# Altium schematic sheet 10_POWER_INPUT.SchDoc
size 594 x 420 mm
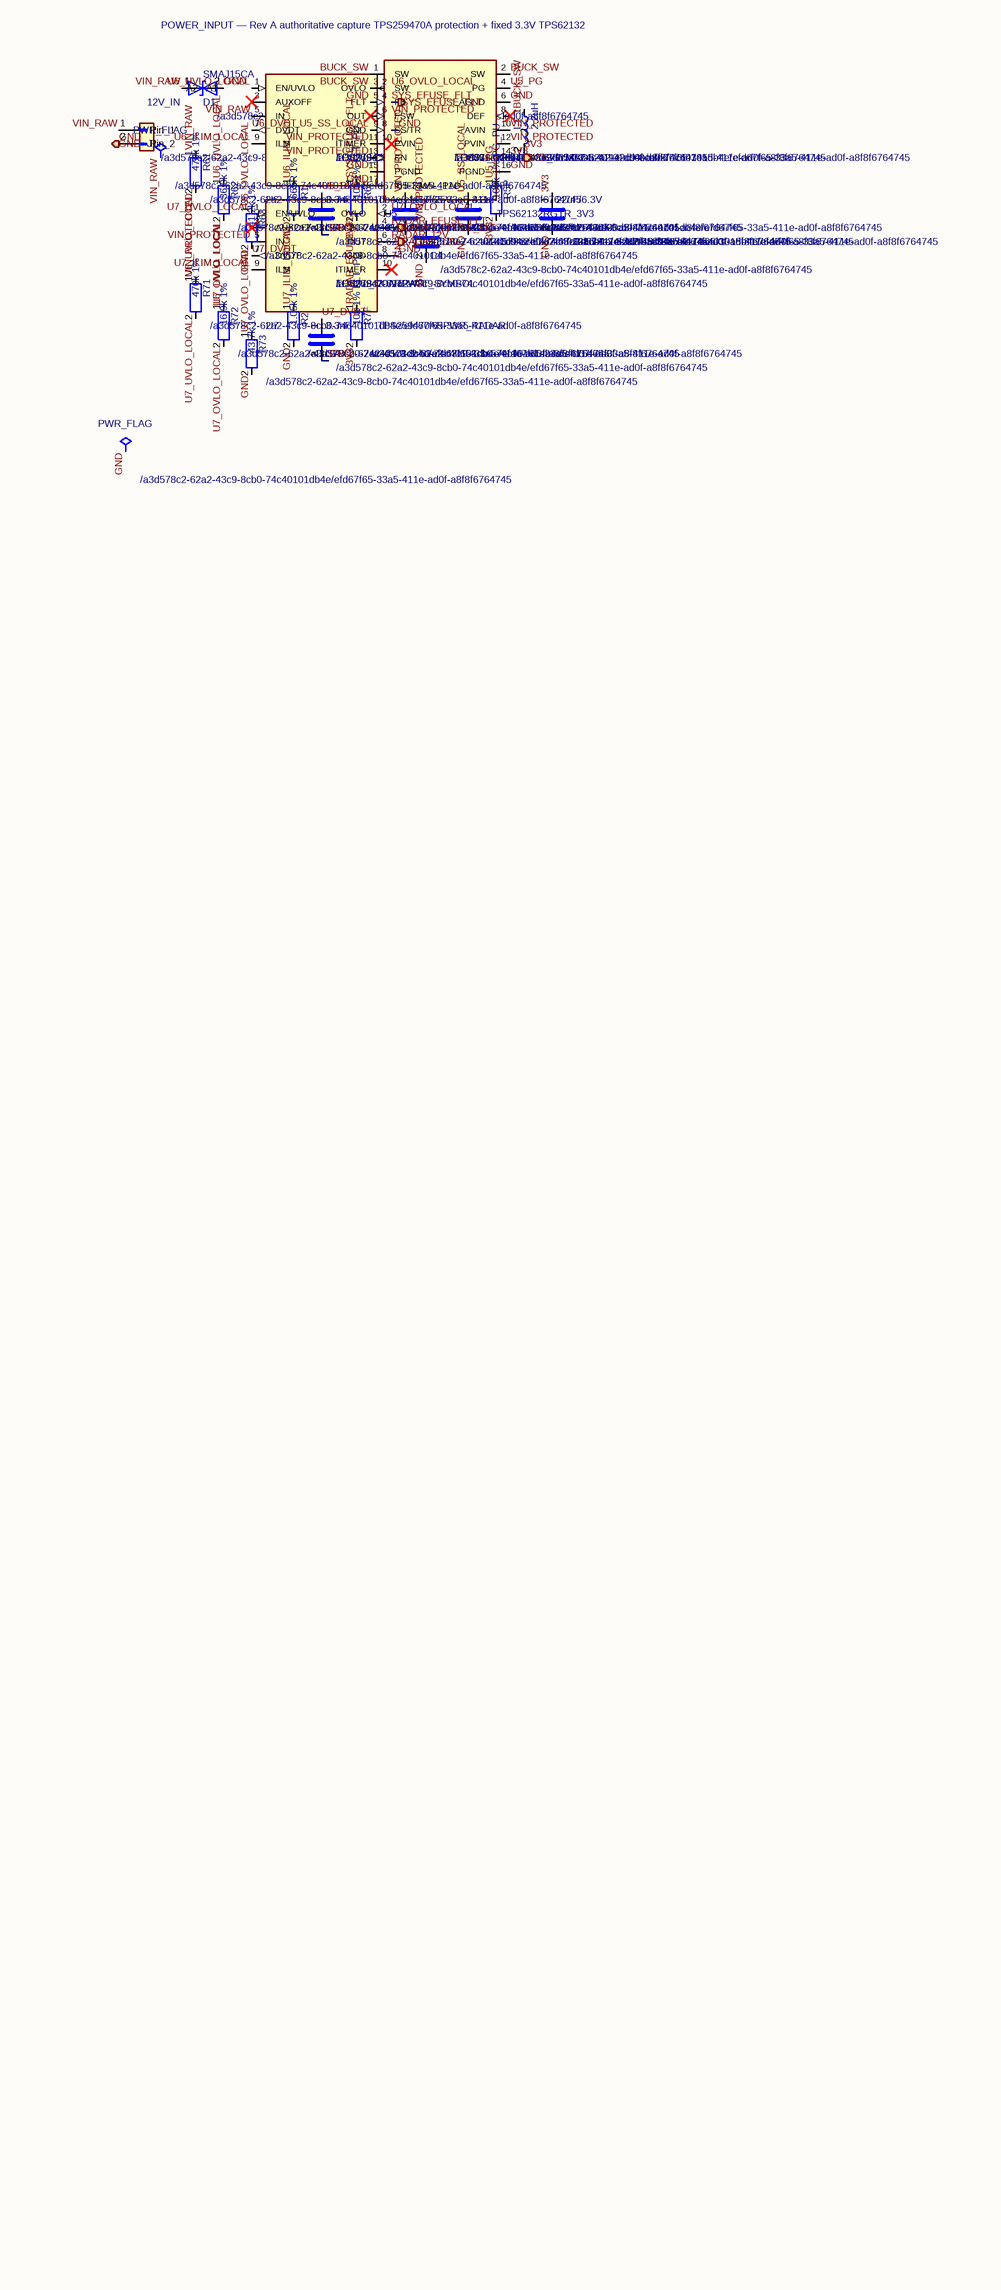
[diagram p0: 10_POWER_INPUT.SchDoc]

## Parts
#FLG0201  hierarchy_path: /a3d578c2-62a2-43c9-8cb0-74c40101db4e/efd67f65-33a5-411e-ad0f-a8f8f6764745  (hidden comment: PWR_FLAG)  (graphical)
#FLG0202  hierarchy_path: /a3d578c2-62a2-43c9-8cb0-74c40101db4e/efd67f65-33a5-411e-ad0f-a8f8f6764745  (hidden comment: PWR_FLAG)  (graphical)
C1  hierarchy_path: /a3d578c2-62a2-43c9-8cb0-74c40101db4e/efd67f65-33a5-411e-ad0f-a8f8f6764745  [C_1206_3216Metric]  (hidden comment: 10uF/25V)
C2  hierarchy_path: /a3d578c2-62a2-43c9-8cb0-74c40101db4e/efd67f65-33a5-411e-ad0f-a8f8f6764745  [C_1206_3216Metric]  (hidden comment: 22uF/6.3V)
C3  hierarchy_path: /a3d578c2-62a2-43c9-8cb0-74c40101db4e/efd67f65-33a5-411e-ad0f-a8f8f6764745  [C_0603_1608Metric]  (hidden comment: 3.3nF)
C4  hierarchy_path: /a3d578c2-62a2-43c9-8cb0-74c40101db4e/efd67f65-33a5-411e-ad0f-a8f8f6764745  [C_0603_1608Metric]  (hidden comment: 100nF/25V)
C6D  hierarchy_path: /a3d578c2-62a2-43c9-8cb0-74c40101db4e/efd67f65-33a5-411e-ad0f-a8f8f6764745  [C_0603_1608Metric]  (hidden comment: 3.3nF)
C7D  hierarchy_path: /a3d578c2-62a2-43c9-8cb0-74c40101db4e/efd67f65-33a5-411e-ad0f-a8f8f6764745  [C_0603_1608Metric]  (hidden comment: 3.3nF)
D1  hierarchy_path: /a3d578c2-62a2-43c9-8cb0-74c40101db4e/efd67f65-33a5-411e-ad0f-a8f8f6764745  [D_SMA]  (hidden comment: SMAJ15CA)
J1  hierarchy_path: /a3d578c2-62a2-43c9-8cb0-74c40101db4e/efd67f65-33a5-411e-ad0f-a8f8f6764745  [Molex_43650-0200_RA_THT_2P]  (hidden comment: 12V_IN)
L1  hierarchy_path: /a3d578c2-62a2-43c9-8cb0-74c40101db4e/efd67f65-33a5-411e-ad0f-a8f8f6764745  [Coilcraft_XFL4020_4x4]  (hidden comment: 2.2uH)
R1  hierarchy_path: /a3d578c2-62a2-43c9-8cb0-74c40101db4e/efd67f65-33a5-411e-ad0f-a8f8f6764745  [R_0603_1608Metric]  (hidden comment: 665R 1%)
R2  hierarchy_path: /a3d578c2-62a2-43c9-8cb0-74c40101db4e/efd67f65-33a5-411e-ad0f-a8f8f6764745  [R_0603_1608Metric]  (hidden comment: 1.05k 1%)
R5P  hierarchy_path: /a3d578c2-62a2-43c9-8cb0-74c40101db4e/efd67f65-33a5-411e-ad0f-a8f8f6764745  [R_0603_1608Metric]  (hidden comment: 100k 1% PG_PU)
R6F  hierarchy_path: /a3d578c2-62a2-43c9-8cb0-74c40101db4e/efd67f65-33a5-411e-ad0f-a8f8f6764745  [R_0603_1608Metric]  (hidden comment: 10k 1% FLT_PU)
R7F  hierarchy_path: /a3d578c2-62a2-43c9-8cb0-74c40101db4e/efd67f65-33a5-411e-ad0f-a8f8f6764745  [R_0603_1608Metric]  (hidden comment: 10k 1% FLT_PU)
R61  hierarchy_path: /a3d578c2-62a2-43c9-8cb0-74c40101db4e/efd67f65-33a5-411e-ad0f-a8f8f6764745  [R_0603_1608Metric]  (hidden comment: 470k 1%)
R62  hierarchy_path: /a3d578c2-62a2-43c9-8cb0-74c40101db4e/efd67f65-33a5-411e-ad0f-a8f8f6764745  [R_0603_1608Metric]  (hidden comment: 36.0k 1%)
R63  hierarchy_path: /a3d578c2-62a2-43c9-8cb0-74c40101db4e/efd67f65-33a5-411e-ad0f-a8f8f6764745  [R_0603_1608Metric]  (hidden comment: 41.2k 1%)
R71  hierarchy_path: /a3d578c2-62a2-43c9-8cb0-74c40101db4e/efd67f65-33a5-411e-ad0f-a8f8f6764745  [R_0603_1608Metric]  (hidden comment: 470k 1%)
R72  hierarchy_path: /a3d578c2-62a2-43c9-8cb0-74c40101db4e/efd67f65-33a5-411e-ad0f-a8f8f6764745  [R_0603_1608Metric]  (hidden comment: 16.9k 1%)
R73  hierarchy_path: /a3d578c2-62a2-43c9-8cb0-74c40101db4e/efd67f65-33a5-411e-ad0f-a8f8f6764745  [R_0603_1608Metric]  (hidden comment: 43.7k 1%)
U5  Capture_Status: LOCAL_CONTRACT_SYMBOL  hierarchy_path: /a3d578c2-62a2-43c9-8cb0-74c40101db4e/efd67f65-33a5-411e-ad0f-a8f8f6764745  [VQFN-16-1EP_3x3mm_P0.5mm_EP1.68x1.68mm]  (hidden comment: TPS62132RGTR_3V3)
U6  Capture_Status: LOCAL_CONTRACT_SYMBOL  hierarchy_path: /a3d578c2-62a2-43c9-8cb0-74c40101db4e/efd67f65-33a5-411e-ad0f-a8f8f6764745  [TPS259470A_RPW0010A_VQFN-HR-10_2x2mm_P0.475mm]  (hidden comment: TPS259470ARPWR_SYS)
U7  Capture_Status: LOCAL_CONTRACT_SYMBOL  hierarchy_path: /a3d578c2-62a2-43c9-8cb0-74c40101db4e/efd67f65-33a5-411e-ad0f-a8f8f6764745  [TPS259470A_RPW0010A_VQFN-HR-10_2x2mm_P0.475mm]  (hidden comment: TPS259470ARPWR_RADAR)

## Ports
3V3 (out), GND, RADAR_12V (out), RADAR_EFUSE_FLT (out), SYS_EFUSE_FLT (out)

## Nets
3V3: C2.1 L1.2 R5P.2 R6F.2 R7F.2 U5.14(VOS) ; port 3V3
BUCK_SW: L1.1 U5.1(SW) U5.2(SW) U5.3(SW)
GND: #FLG0202.1 C1.2 C2.2 C3.2 C4.2 C6D.2 C7D.2 D1.2(A2) J1.2(Pin_2) R1.2 R2.2 R63.2 R73.2 U5.5(FB) U5.6(AGND) U5.15(PGND) U5.16(PGND) U5.17(THERMAL_PAD) U6.8(GND) U7.8(GND) ; port GND
RADAR_12V: U7.6(OUT) ; port RADAR_12V
RADAR_EFUSE_FLT: R7F.1 U7.4(FLT) ; port RADAR_EFUSE_FLT
SYS_EFUSE_FLT: R6F.1 U6.4(FLT) ; port SYS_EFUSE_FLT
U5_PG: R5P.1 U5.4(PG)
U5_SS_LOCAL: C3.1 U5.9(SS/TR)
U6_DVDT: C6D.1 U6.7(DVDT)
U6_ILIM_LOCAL: R1.1 U6.9(ILM)
U6_OVLO_LOCAL: R62.2 R63.1 U6.2(OVLO)
U6_UVLO_LOCAL: R61.2 R62.1 U6.1(EN/UVLO)
U7_DVDT: C7D.1 U7.7(DVDT)
U7_ILIM_LOCAL: R2.1 U7.9(ILM)
U7_OVLO_LOCAL: R72.2 R73.1 U7.2(OVLO)
U7_UVLO_LOCAL: R71.2 R72.1 U7.1(EN/UVLO)
VIN_PROTECTED: C1.1 C4.1 R71.1 U5.10(AVIN) U5.11(PVIN) U5.12(PVIN) U5.13(EN) U6.6(OUT) U7.5(IN)
VIN_RAW: #FLG0201.1 D1.1(A1) J1.1(Pin_1) R61.1 U6.5(IN)

Not connected (* = marked no-connect by the designer): U5 7(FSW)* 8(DEF)*; U6 3(AUXOFF)* 10(ITIMER)*; U7 3(AUXOFF)* 10(ITIMER)*

## Notes on the sheet
- POWER_INPUT — Rev A authoritative capture
  TPS259470A protection + fixed 3.3V TPS62132
- 1
- 2
- 3
- 4
- 5
- 6
- 7
- 8
- 9
- 10
- 11
- A
- B
- C
- D
- E
- F
- G
- H
- Title: EVT_SYS_CARRIER
- File: 10_POWER_INPUT.kicad_sch
- Sheet: /
- KiCad E.D.A.  kicad (5.1.4)-1
- Size: A2
- Date:
- Rev:
- Id: 1/1

## Library data of the parts
C1-C4 C6D C7D = C
  C1: Value: 10uF/25V; Footprint: Capacitor_SMD:C_1206_3216Metric
  C2: Value: 22uF/6.3V; Footprint: Capacitor_SMD:C_1206_3216Metric
  C3 C6D C7D: Value: 3.3nF; Footprint: Capacitor_SMD:C_0603_1608Metric
  C4: Value: 100nF/25V; Footprint: Capacitor_SMD:C_0603_1608Metric
D1 = D_TVS: Value: SMAJ15CA; Footprint: Diode_SMD:D_SMA
J1 = Conn_01x02: Value: 12V_IN; Footprint: SystemCarrier_Altium:Molex_43650-0200_RA_THT_2P
L1 = L: Value: 2.2uH; Footprint: SystemCarrier_Altium:Coilcraft_XFL4020_4x4
R1 R2 R5P R6F R7F R61-R63 R71-R73 = R: Footprint: Resistor_SMD:R_0603_1608Metric
  R1: Value: 665R 1%
  R2: Value: 1.05k 1%
  R5P: Value: 100k 1% PG_PU
  R6F R7F: Value: 10k 1% FLT_PU
  R61 R71: Value: 470k 1%
  R62: Value: 36.0k 1%
  R63: Value: 41.2k 1%
  R72: Value: 16.9k 1%
  R73: Value: 43.7k 1%
U5 = TPS62132RGTR: MPN: TPS62132RGTR; Value: TPS62132RGTR_3V3; Footprint: Package_DFN_QFN:VQFN-16-1EP_3x3mm_P0.5mm_EP1.68x1.68mm
U6 U7 = TPS259470ARPWR: MPN: TPS259470ARPWR; Footprint: SystemCarrier_Local:TPS259470A_RPW0010A_VQFN-HR-10_2x2mm_P0.475mm
  U6: Value: TPS259470ARPWR_SYS
  U7: Value: TPS259470ARPWR_RADAR
#FLG0201 #FLG0202 = PWR_FLAG: Value: PWR_FLAG